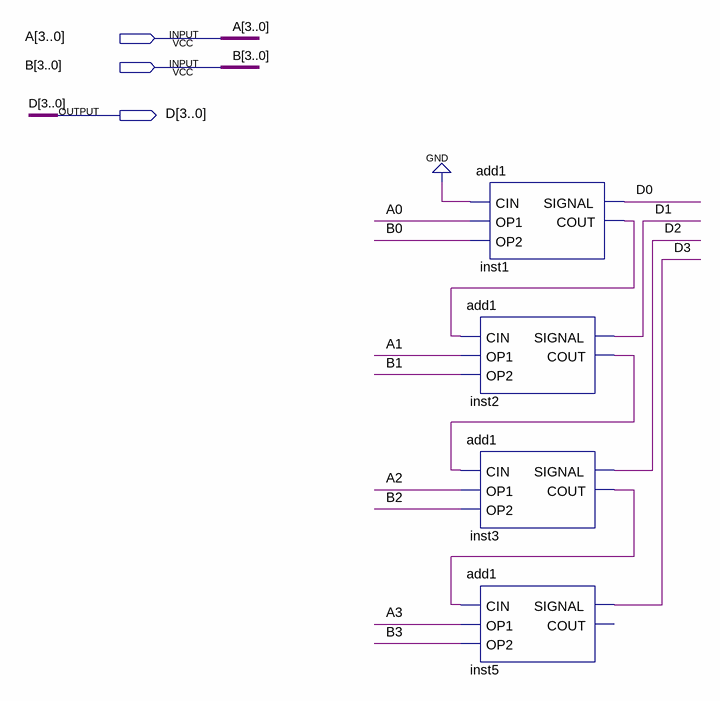
[diagram p0: schematic sheet]
// Quartus schematic add4.bdf as structural Verilog: 4 symbols, 3 pins
module add4 (
  input  [3:0] A,
  input  [3:0] B,
  output [3:0] D
);

  wire inst1_cout, inst2_cout, inst3_cout;

  add1 inst1 (.CIN(1'b0), .OP1(A[0]), .OP2(B[0]), .SIGNAL(D[0]), .COUT(inst1_cout));
  add1 inst2 (.CIN(inst1_cout), .OP1(A[1]), .OP2(B[1]), .SIGNAL(D[1]), .COUT(inst2_cout));
  add1 inst3 (.CIN(inst2_cout), .OP1(A[2]), .OP2(B[2]), .SIGNAL(D[2]), .COUT(inst3_cout));
  add1 inst5 (.CIN(inst3_cout), .OP1(A[3]), .OP2(B[3]), .SIGNAL(D[3]));  // open: COUT
endmodule
